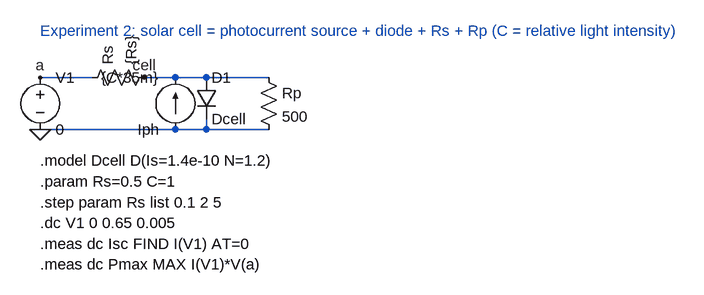
[diagram p0: schematic Solarzelle_IU_Serienwiderstand.asc]
Solarzelle_IU_Serienwiderstand.asc, the LTspice schematic file:
Version 4.1
SHEET 1 880 420
WIRE 80 96 160 96
WIRE 240 96 288 96
WIRE 288 96 336 96
WIRE 336 96 432 96
WIRE 336 160 336 176
WIRE 80 176 288 176
WIRE 288 176 336 176
WIRE 336 176 432 176
FLAG 80 176 0
FLAG 80 96 a
FLAG 240 96 cell
SYMBOL voltage 80 80 R0
SYMATTR InstName V1
SYMATTR Value 0
SYMBOL res 144 112 R270
SYMATTR InstName Rs
SYMATTR Value {Rs}
SYMBOL current 288 176 R180
SYMATTR InstName Iph
SYMATTR Value {C*35m}
SYMBOL diode 320 96 R0
SYMATTR InstName D1
SYMATTR Value Dcell
SYMBOL res 416 80 R0
SYMATTR InstName Rp
SYMATTR Value 500
TEXT 80 24 Left 2 ;Experiment 2: solar cell = photocurrent source + diode + Rs + Rp (C = relative light intensity)
TEXT 80 224 Left 2 !.model Dcell D(Is=1.4e-10 N=1.2)
TEXT 80 256 Left 2 !.param Rs=0.5 C=1
TEXT 80 288 Left 2 !.step param Rs list 0.1 2 5
TEXT 80 320 Left 2 !.dc V1 0 0.65 0.005
TEXT 80 352 Left 2 !.meas dc Isc FIND I(V1) AT=0
TEXT 80 384 Left 2 !.meas dc Pmax MAX I(V1)*V(a)

The netlist it stands for:
* Solarzelle_IU_Serienwiderstand.asc
V1 a 0 0
Rs a cell {Rs}
Iph 0 cell {C*35m}
D1 cell 0 Dcell
Rp cell 0 500
.model D D
.lib standard.dio
* Experiment 2: solar cell = photocurrent source + diode + Rs + Rp (C = relative light intensity)
.model Dcell D(Is=1.4e-10 N=1.2)
.param Rs=0.5 C=1
.step param Rs list 0.1 2 5
.dc V1 0 0.65 0.005
.meas dc Isc FIND I(V1) AT=0
.meas dc Pmax MAX I(V1)*V(a)
.backanno
.end